# Altium schematic sheet I2C_Shield.SchDoc
size A3; SheetNumber: 1; SheetTotal: 1
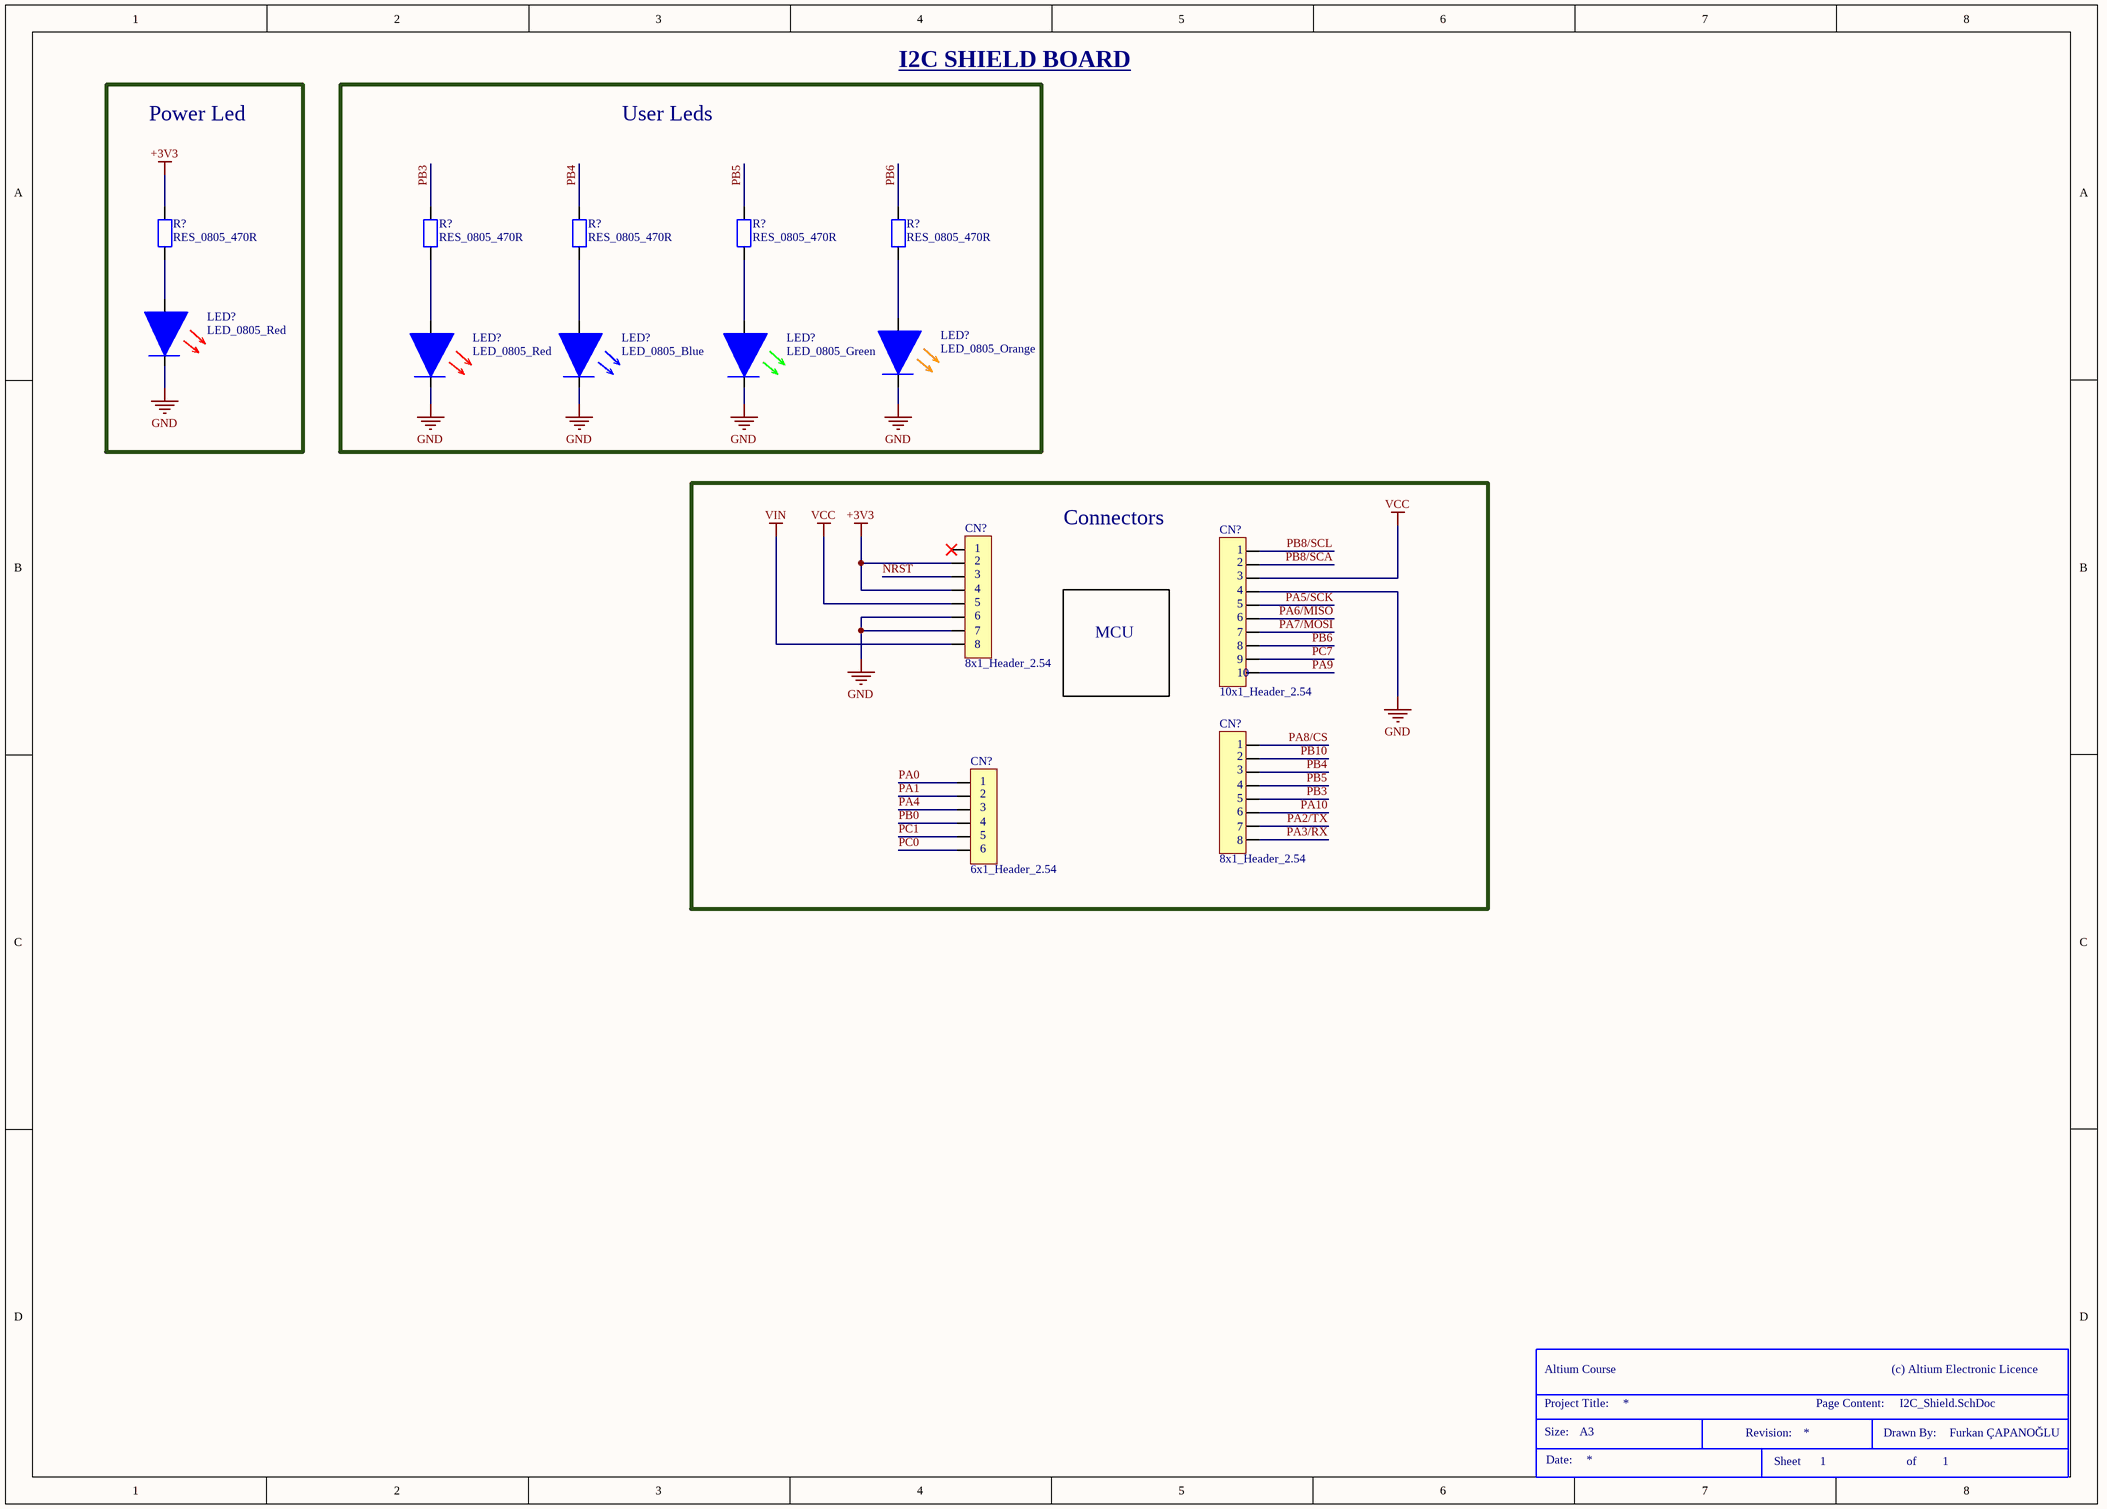
[diagram p0: I2C_Shield.SchDoc]

## Parts
(Parts that share a designator on the sheet are numbered #1, #2 ... from top to bottom, then left to right.)
*?  Size: A3  Drawn By: Furkan ÇAPANOĞLU  (hidden comment: Title Block)  (graphical)
CN?#1  8x1_Header_2.54  [8x1_2.54MM_HEADER]
CN?#2  10x1_Header_2.54  [10x1_2.54MM_HEADER]
CN?#3  8x1_Header_2.54  [8x1_2.54MM_HEADER]
CN?#4  6x1_Header_2.54  [6x1_2.54MM_HEADER]
LED?#1  LED_0805_Red  [LED_0805]
LED?#2  LED_0805_Orange  [LED_0805]
LED?#3  LED_0805_Red  [LED_0805]
LED?#4  LED_0805_Blue  [LED_0805]
LED?#5  LED_0805_Green  [LED_0805]
R?#1  RES_0805_470R  [RES_0805]
R?#2  RES_0805_470R  [RES_0805]
R?#3  RES_0805_470R  [RES_0805]
R?#4  RES_0805_470R  [RES_0805]
R?#5  RES_0805_470R  [RES_0805]

## Blocks framed on the sheet
Power Led: LED?#1 R?#1
I2C SHIELD BOARD: LED?#2-LED?#5 R?#2-R?#5
Connectors: CN?#1-CN?#4

## Nets
+3V3: CN?#1.02 CN?#1.04 R?#1.2
GND: CN?#1.06 CN?#1.07 CN?#2.04 LED?#1.C LED?#2.C LED?#3.C LED?#4.C LED?#5.C
VCC: CN?#1.05 CN?#2.03
VIN: CN?#1.08
NRST: CN?#1.03
PA0: CN?#4.01
PA1: CN?#4.02
PA2/TX: CN?#3.07
PA3/RX: CN?#3.08
PA4: CN?#4.03
PA5/SCK: CN?#2.05
PA6/MISO: CN?#2.06
PA7/MOSI: CN?#2.07
PA8/CS: CN?#3.01
PA9: CN?#2.10
PA10: CN?#3.06
PB0: CN?#4.04
PB3: CN?#3.05 R?#2.2
PB4: CN?#3.03 R?#3.2
PB5: CN?#3.04 R?#4.2
PB6: CN?#2.08 R?#5.2
PB8/SCA: CN?#2.02
PB8/SCL: CN?#2.01
PB10: CN?#3.02
PC0: CN?#4.06
PC1: CN?#4.05
PC7: CN?#2.09
NetLED?#1_A: LED?#1.A R?#1.1
NetLED?#2_A: LED?#2.A R?#5.1
NetLED?#3_A: LED?#3.A R?#2.1
NetLED?#4_A: LED?#4.A R?#3.1
NetLED?#5_A: LED?#5.A R?#4.1

Not connected (* = marked no-connect by the designer): CN?#1 01*

## Notes on the sheet
- User Leds
- MCU
- (in symbol 6x1_Header_2.54) 1; 2; 3; 4; 5; 6
- (in symbol 8x1_Header_2.54) 1; 2; 3; 4; 5; 6; 7; 8
- (in symbol 10x1_Header_2.54) 1; 2; 3; 4; 5; 6; 7; 8; 9
- (in symbol Title Block) Altium Course; (c) Altium Electronic Licence; Project Title:; Page Content:; Size:; Revision:; Drawn By:; Date:; Sheet; of

## Library data of the parts
CN?#1 CN?#3 = 8x1_Header_2.54: Arduino Boards Connector; Manufacturer: https://www.e-komponent.com/arduino-boards-or-other-mcu-boards-connector?gad_source=4&gclid=CjwKCAjw74e1BhBnEiwAbqOAjEA8jWhKcu_OL1z7lHxmv6-QK3mXRxhYjeYuodVaUuIY0-tXQ3XZXRoCzkoQAvD_BwE; Package Size: 8x1
CN?#2 = 10x1_Header_2.54: Arduino Boards Connector; Manufacturer: https://www.e-komponent.com/arduino-boards-or-other-mcu-boards-connector?gad_source=4&gclid=CjwKCAjw74e1BhBnEiwAbqOAjEA8jWhKcu_OL1z7lHxmv6-QK3mXRxhYjeYuodVaUuIY0-tXQ3XZXRoCzkoQAvD_BwE; Package Size: 10x1
CN?#4 = 6x1_Header_2.54: Arduino Boards Connector; Manufacturer: https://www.e-komponent.com/arduino-boards-or-other-mcu-boards-connector?gad_source=4&gclid=CjwKCAjw74e1BhBnEiwAbqOAjEA8jWhKcu_OL1z7lHxmv6-QK3mXRxhYjeYuodVaUuIY0-tXQ3XZXRoCzkoQAvD_BwE; Package Size: 6x1
LED?#1 LED?#3 = LED_0805_Red: LED SMD 0805 RED 550mcd; Voltage Rating: 2.6; Current: 20mA; Package Size: 0805; Manufacturer: https://ozdisan.com/led-ve-aydinlatma-cozumleri/led-komponentler/sinyal-ledler-tek-renkli/HL-PSC-2012U51GC/471651
LED?#2 = LED_0805_Orange: LED SMD 0805 ORANGE 550mcd; Voltage Rating: 2.6; Current: 20mA; Package Size: 0805; Manufacturer: https://ozdisan.com/led-ve-aydinlatma-cozumleri/led-komponentler/sinyal-ledler-tek-renkli/HL-PSC-2012U51GC/471651
LED?#4 = LED_0805_Blue: LED SMD 0805 BLUE 550mcd; Voltage Rating: 2.6; Current: 20mA; Package Size: 0805; Manufacturer: https://ozdisan.com/led-ve-aydinlatma-cozumleri/led-komponentler/sinyal-ledler-tek-renkli/HL-PSC-2012U51GC/471651
LED?#5 = LED_0805_Green: LED SMD 0805 GREEN 550mcd; Voltage Rating: 2.6; Current: 20mA; Package Size: 0805; Manufacturer: https://ozdisan.com/led-ve-aydinlatma-cozumleri/led-komponentler/sinyal-ledler-tek-renkli/HL-PSC-2012U51GC/471651
R?#1-R?#5 = RES_0805_470R: 0805 470 Ohms 5% 1/8W; Voltage Rating: 150V; Tolerance: %5; Manufacturer: https://ozdisan.com/pasif-komponentler/direncler/smt-smd-ve-cip-direncler/RC0805JR-07470RL/504397; Package Size: 0805